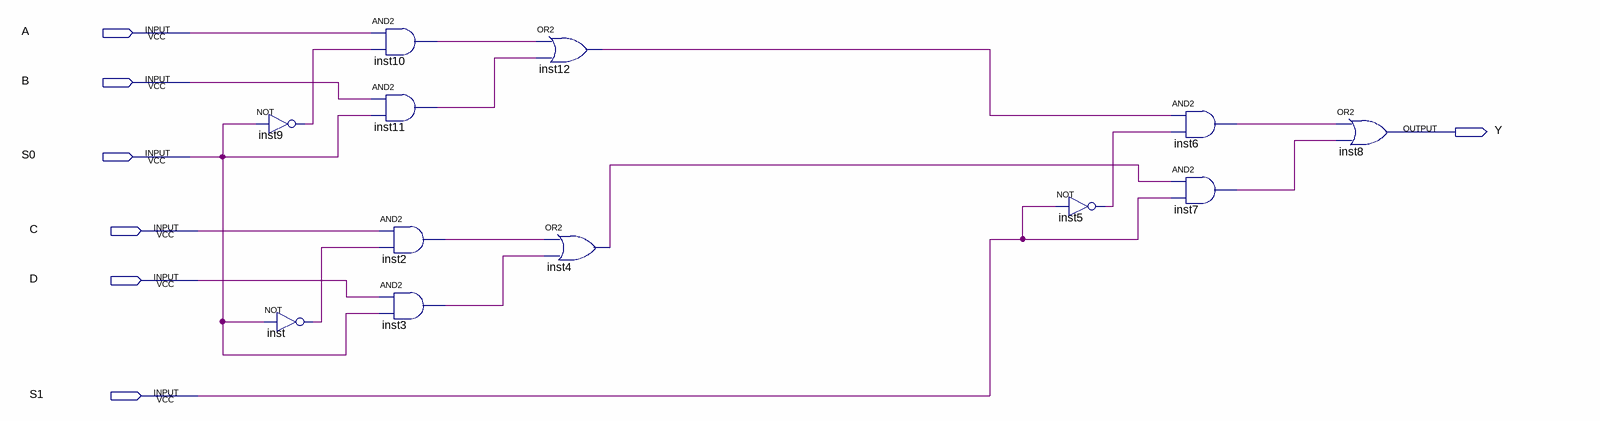
[diagram p0: schematic sheet]
// Quartus schematic Lab122.bdf as structural Verilog: 12 symbols, 7 pins
module Lab122 (
  input  A,
  input  B,
  input  S0,
  input  C,
  input  D,
  input  S1,
  output Y
);

  wire inst2_out, inst3_out, inst4_out, inst5_out, inst6_out, inst7_out, inst9_out, inst10_out, inst11_out,
       inst12_out, inst_out;

  not inst9 (inst9_out, S0);
  not inst (inst_out, S0);
  and inst10 (inst10_out, A, inst9_out);
  and inst11 (inst11_out, B, S0);
  and inst2 (inst2_out, C, inst_out);
  and inst3 (inst3_out, D, S0);
  or inst12 (inst12_out, inst10_out, inst11_out);
  or inst4 (inst4_out, inst2_out, inst3_out);
  not inst5 (inst5_out, S1);
  and inst6 (inst6_out, inst12_out, inst5_out);
  and inst7 (inst7_out, inst4_out, S1);
  or inst8 (Y, inst6_out, inst7_out);
endmodule
